# EasyEDA Pro project ProPrj_小车底盘_2026-10-30.epro, schematic Schematic1
Assembly Variant: Basic; Board Name: Board1; Create Date: 2026-10-29; Page Name: P1; Project Name: 小车底盘; Schematic Name: Schematic1; Update Date: 2026-10-29; Company: 嘉立创EDA; Page Size: A4; Version: V1.0
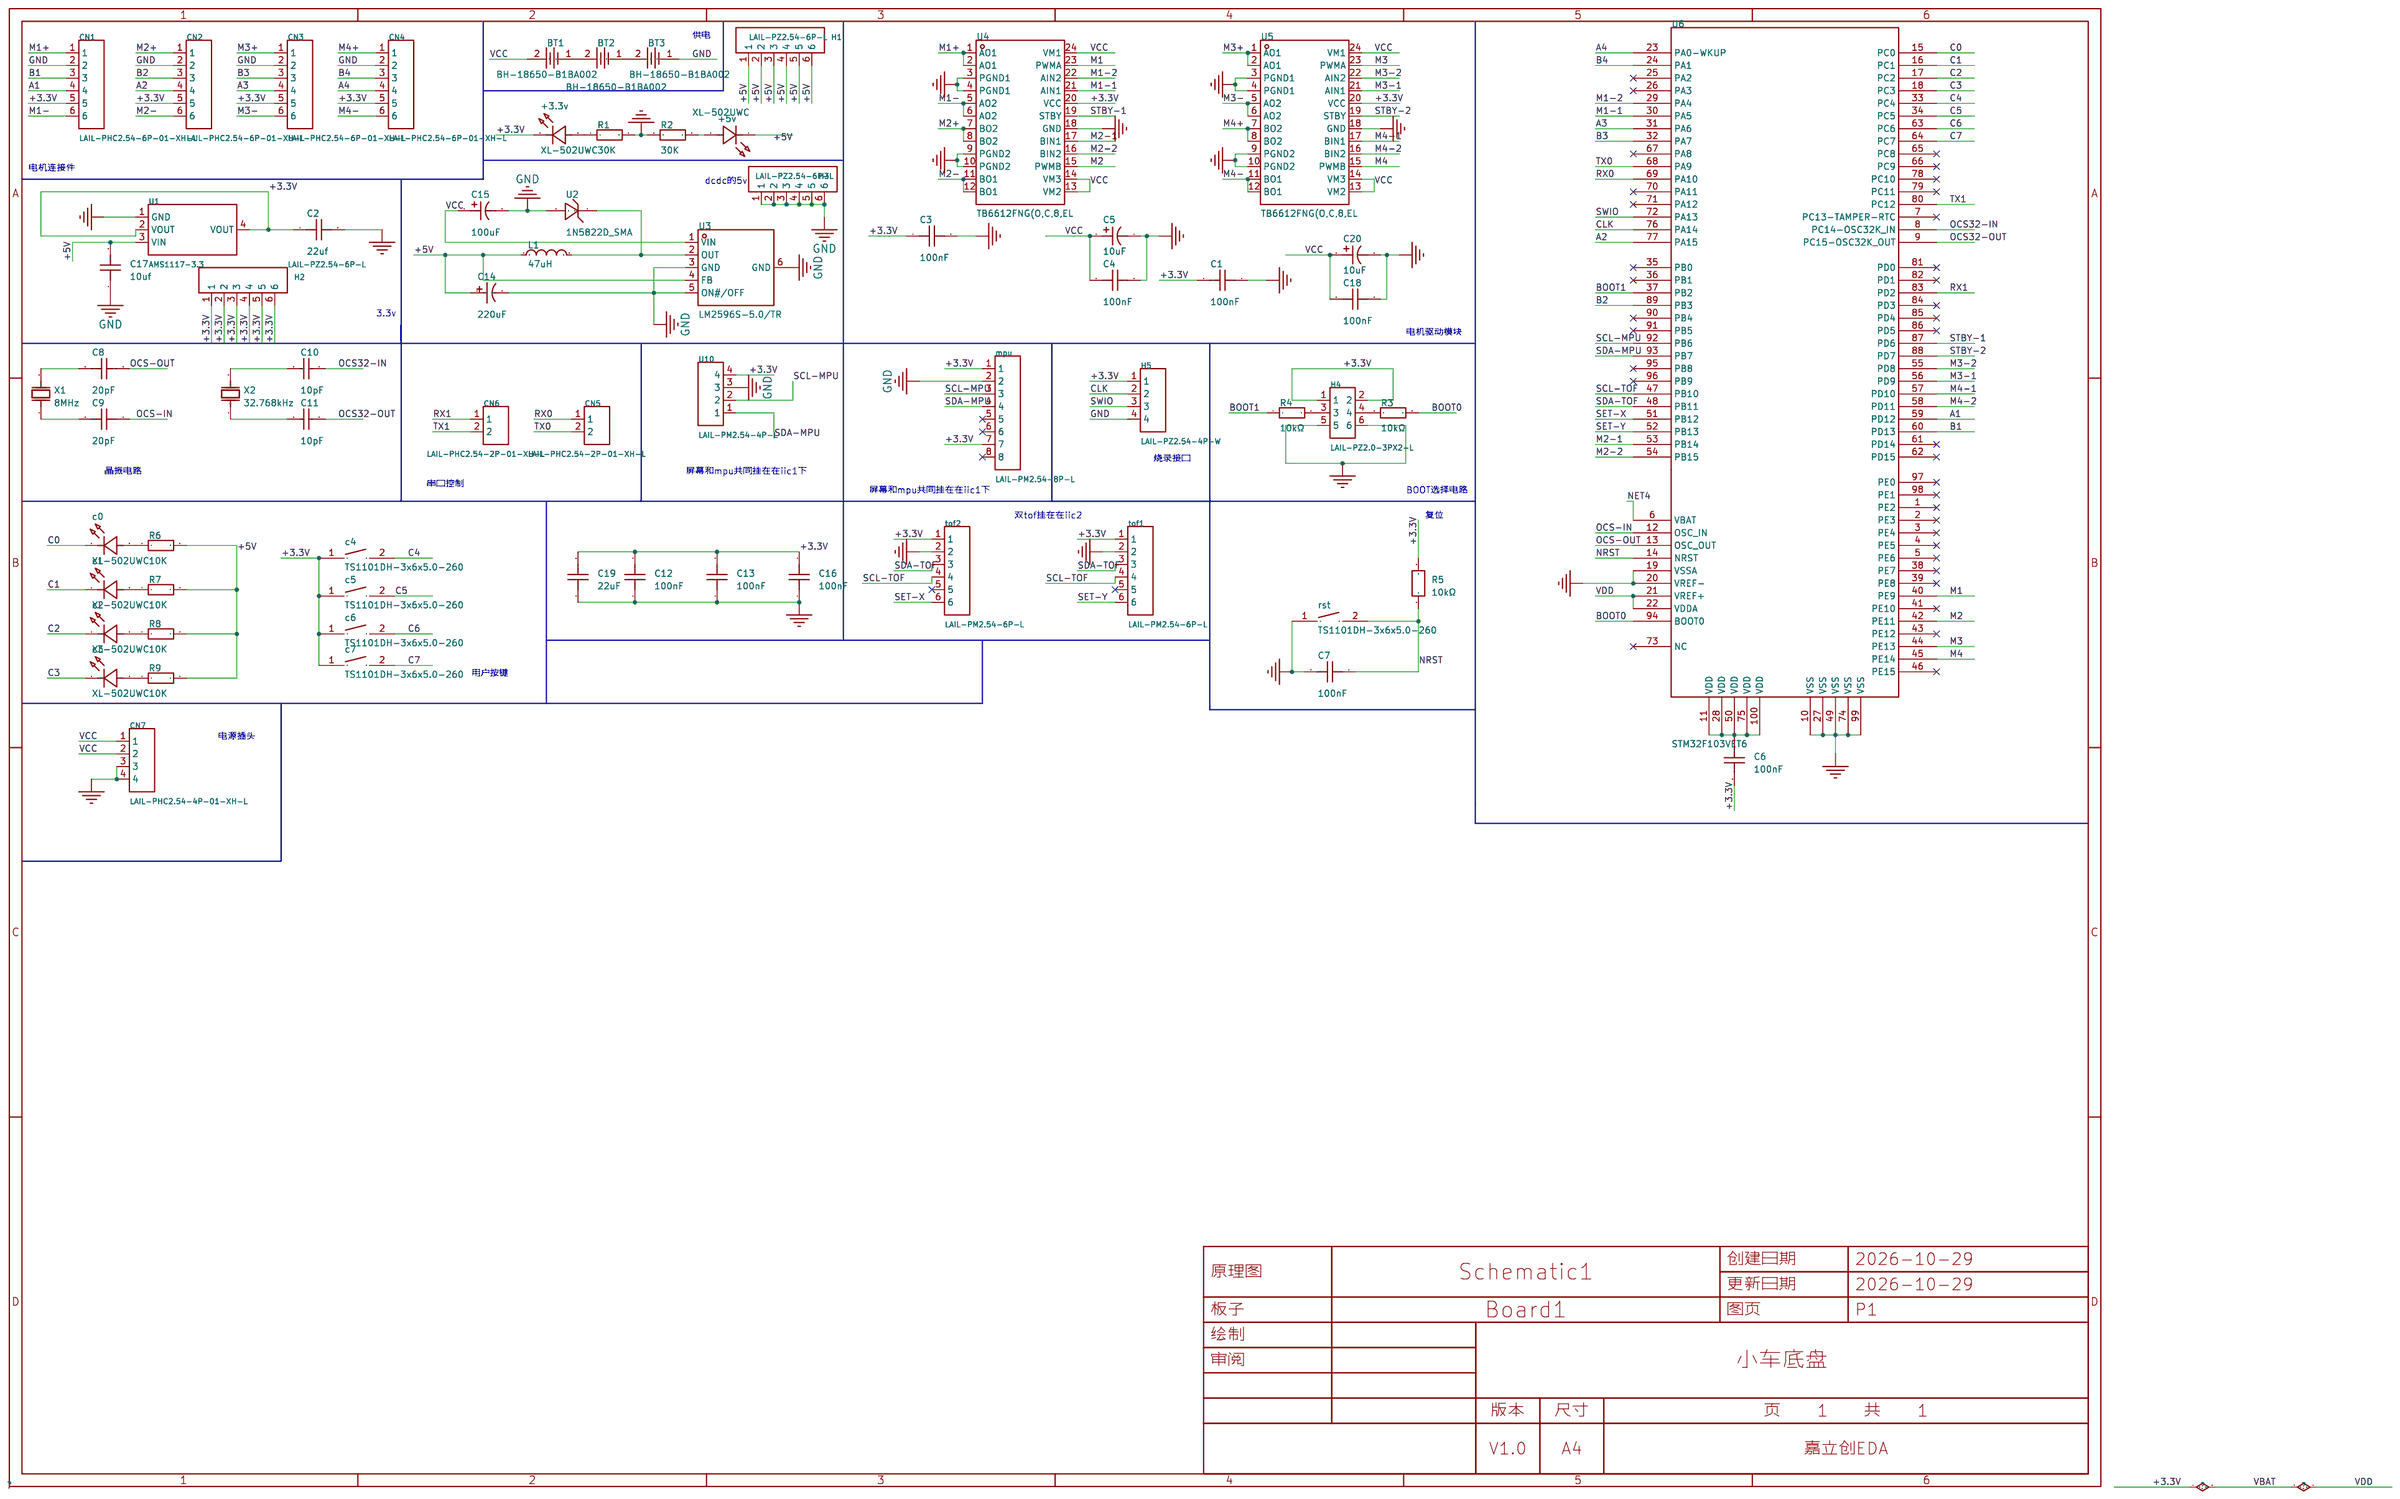
[diagram p0: schematic sheet]

## Parts
+3.3v  XL-502UWC  [LED-TH_BD5.9-P2.54-RD_WHITE]
+5v  XL-502UWC  [LED-TH_BD5.9-P2.54-RD_WHITE]
BT1  BH-18650-B1BA002  [BATTERY-SMD_18650-1S-L77.1-W20.7-1]
BT2  BH-18650-B1BA002  [BATTERY-SMD_18650-1S-L77.1-W20.7-1]
BT3  BH-18650-B1BA002  [BATTERY-SMD_18650-1S-L77.1-W20.7-1]
c0  XL-502UWC  [LED-TH_BD5.9-P2.54-RD_WHITE]
c1  XL-502UWC  [LED-TH_BD5.9-P2.54-RD_WHITE]
C1  100nF  [C0603]
C2  22uf  [C0603]
c2  XL-502UWC  [LED-TH_BD5.9-P2.54-RD_WHITE]
C3  100nF  [C0603]
c3  XL-502UWC  [LED-TH_BD5.9-P2.54-RD_WHITE]
C4  100nF  [C0603]
c4  TS1101DH-3x6x5.0-260  [SW-TH_L6.1-W3.5-P6.60-LS8.0]
C5  10uF  [CAP-SMD_L7.3-W4.3-RD_177EC0013]
c5  TS1101DH-3x6x5.0-260  [SW-TH_L6.1-W3.5-P6.60-LS8.0]
C6  100nF  [C0805]
c6  TS1101DH-3x6x5.0-260  [SW-TH_L6.1-W3.5-P6.60-LS8.0]
C7  100nF  [C0805]
c7  TS1101DH-3x6x5.0-260  [SW-TH_L6.1-W3.5-P6.60-LS8.0]
C8  20pF  [C0805]
C9  20pF  [C0805]
C10  10pF  [C0805]
C11  10pF  [C0805]
C12  100nF  [C0805]
C13  100nF  [C0805]
C14  220uF  [CAP-TH_BD8.0-P3.50-D0.6-FD]
C15  100uF  [CAP-SMD_BD6.3-L6.6-W6.6-RD]
C16  100nF  [C0805]
C17  10uf  [C0603]
C18  100nF  [C0603]
C19  22uF  [C0603]
C20  10uF  [CAP-SMD_L7.3-W4.3-RD_177EC0013]
CN1  LAIL-PHC2.54-6P-01-XH-L  [CONN-TH_AXH-6A-11]
CN2  LAIL-PHC2.54-6P-01-XH-L  [CONN-TH_AXH-6A-11]
CN3  LAIL-PHC2.54-6P-01-XH-L  [CONN-TH_AXH-6A-11]
CN4  LAIL-PHC2.54-6P-01-XH-L  [CONN-TH_AXH-6A-11]
CN5  LAIL-PHC2.54-2P-01-XH-L  [CONN-TH_2P-P2.50_HC-XH-2A-G]
CN6  LAIL-PHC2.54-2P-01-XH-L  [CONN-TH_2P-P2.50_HC-XH-2A-G]
CN7  LAIL-PHC2.54-4P-01-XH-L  [CONN-TH_LAIL-PHC2.54-4P-01-XH-L]
H1  LAIL-PZ2.54-6P-L  [CONN-TH_LAIL-PZ2.54-6P-L]
H2  LAIL-PZ2.54-6P-L  [CONN-TH_LAIL-PZ2.54-6P-L]
H3  LAIL-PZ2.54-6P-L  [CONN-TH_LAIL-PZ2.54-6P-L]
H4  LAIL-PZ2.0-3PX2-L  [CONN-TH_LAIL-PZ2.0-3PX2-L]
H5  LAIL-PZ2.54-4P-W  [HDR-TH_LAIL-PZ2.54-4P-W]
L1  47uH  [IND-SMD_L12.3-W12.3]
mpu  LAIL-PM2.54-8P-L  [HDR-TH_LAIL-PM2.54-8P-L]
R1  30K  [R0603]
R2  30K  [R0603]
R3  10kΩ  [R0805]
R4  10kΩ  [R0805]
R5  10kΩ  [R0603]
R6  10K  [R0603]
R7  10K  [R0603]
R8  10K  [R0603]
R9  10K  [R0603]
rst  TS1101DH-3x6x5.0-260  [SW-TH_L6.1-W3.5-P6.60-LS8.0]
tof1  LAIL-PM2.54-6P-L  [HDR-TH_LAIL-PM2.54-6P-L]
tof2  LAIL-PM2.54-6P-L  [HDR-TH_LAIL-PM2.54-6P-L]
U1  AMS1117-3.3  [SOT-223-3_L6.5-W3.4-P2.30-LS7.0-BR]
U2  1N5822D_SMA  [SMA_L4.3-W2.6-LS5.2-RD]
U3  LM2596S-5.0/TR  [TO-263-5_L10.1-W8.7-P1.70-LS14.4-BR]
U4  TB6612FNG(O,C,8,EL  [SSOP-24_L8.4-W5.8-P0.65-LS7.8-BL]
U5  TB6612FNG(O,C,8,EL  [SSOP-24_L8.4-W5.8-P0.65-LS7.8-BL]
U6  STM32F103VET6  [LQFP-100_L14.0-W14.0-P0.50-LS16.0-BL]
U10  LAIL-PM2.54-4P-L  [HDR-TH_4P-P2.54-V-F]
X1  8MHz  [CRYSTAL-SMD_L5.0-W3.2]
X2  32.768kHz  [CRYSTAL-SMD_L3.2-W1.5-1]

## Library data of the parts
+3.3v +5v c0-c3 = XL-502UWC: 灯头类型:5mm圆形灯头;发光颜色:白色;正向压降(Vf):3.3V;功率:70mW;测试电流:20mA;波长:-;二极管配置:独立二极管;透镜颜色:无色透明透镜;色温:9000K~20000K;发光强度:20cd;发光角度:30°;载带方式:-;工作温度:-25℃~+85℃;; LCSC Part Name: F5白发白短脚; Supplier Part: C2895480; Manufacturer: XINGLIGHT(成兴光); Supplier Footprint: 插件,D=5mm; JLCPCB Part Class: Extended Part; Datasheet: https://item.szlcsc.com/datasheet/XL-502UWC/3136195.html; Supplier: LCSC; Lamp Holder Type: 5mm圆形灯头; Illumination Color: 白色; Voltage - Forward(Vf): 3.3V; Power(Watts): 70mW; Test Current: 20mA; Diode Configuration: 独立二极管; Lens Color: 无色透明透镜; Color Temperature: 9000K~20000K; Luminous Intensity: 20cd; Viewing Angle: 30°; Operating Temperature: -25℃~+85℃
BT1-BT3 = BH-18650-B1BA002: BHAu SMT/适用电池18650平头电芯//电池底座/ 卧式自动化生产贴片电池盒/符合耐高温SMT回流焊工艺/材质：PA46/SUS304 T=0.35mm/镀金/; LCSC Part Name: MYOUNG(美阳)电池盒 BHAu 适用电池18650平头电芯、电池底座、卧式自动化生产贴片电池盒、SMT 180° TYPE; Supplier Part: C2988620; Manufacturer: MYOUNG(美阳); JLCPCB Part Class: Extended Part; Datasheet: https://item.szlcsc.com/datasheet/BH-18650-B1BA002/3446919.html; Supplier: LCSC; Type: 电池盒; Operating Temperature: -25~85℃; Contact material: 磷青铜; Contact coating: 镀金; Applicable battery specifications: 18650
C1-C4 C17 C18 = CAP_0603: Supplier Footprint: 0603
c4-c7 rst = TS1101DH-3x6x5.0-260: 轻触开关3.5x6x5.0立式插件，260GF，2.6N，黑色基座; Supplier Part: C54123271; Manufacturer: CAX(创都); Supplier Footprint: 插件,6.1x3.5mm; JLCPCB Part Class: Extended Part; Datasheet: https://item.szlcsc.com/datasheet/TS1101DH-3x6x5.0-260/57348502.html; Supplier: LCSC
C5 C20 = TA16R0M100AR40: 容值:100uF;精度:±20%;额定电压:16V;等效串联电阻(ESR):40mΩ@100kHz;; LCSC Part Name: 100uF ±20% 16V; Supplier Part: C49332981; Manufacturer: JIERR(捷而瑞); Supplier Footprint: CASE-A-7343-19(mm); JLCPCB Part Class: Extended Part; Datasheet: https://item.szlcsc.com/datasheet/TA16R0M100AR40/51817335.html; Supplier: LCSC; Tolerance: ±20%; Voltage Rating: 16V; Current - Leakage: 160uA@20℃,2min; Ripple Current: 2.2A@100kHz; Equivalent Series Resistance(ESR): 40mΩ@100kHz; Operating Temperature: -55℃~+105℃
C6 C7 C12 C13 C16 = FCC0805B104K500DT: 容值:100nF;精度:±10%;额定电压:50V;温度系数:X7R;; LCSC Part Name: 100nF ±10% 50V; Supplier Part: C5137467; Manufacturer: FOJAN(富捷); Supplier Footprint: 0805; JLCPCB Part Class: Extended Part; Datasheet: https://item.szlcsc.com/datasheet/FCC0805B104K500DT/5746969.html; Supplier: LCSC; Tolerance: ±10%; Voltage Rating: 50V; Temperature Coefficient: X7R; Operating Temperature: -55℃~+125℃
C8 C9 = 0805CG200J500NT: 容值:20pF;精度:±5%;额定电压:50V;温度系数:C0G;; LCSC Part Name: 20pF ±5% 50V; Supplier Part: C94472; Manufacturer: FH(风华); Supplier Footprint: 0805; JLCPCB Part Class: Extended Part; Datasheet: https://item.szlcsc.com/datasheet/0805CG200J500NT/95670.html; Supplier: LCSC; Tolerance: ±5%; Voltage Rating: 50V; Temperature Coefficient: C0G
C10 C11 = CC0805JRNPO9BN100: 容值:10pF;精度:±5%;额定电压:50V;材质(温度系数):NP0;; LCSC Part Name: 10pF ±5% 50V; Supplier Part: C107107; Manufacturer: YAGEO(国巨); Supplier Footprint: 0805; JLCPCB Part Class: Extended Part; Datasheet: https://atta.szlcsc.com/upload/public/pdf/source/20231121/E6B7358C10879AC104478A67BFFD3D0E.pdf; Supplier: LCSC; Tolerance: ±5%; Voltage Rated: 50V; Temperature Coefficient: NP0
C14 = ERS1VM221F12OT: 容值:220uF;精度:±20%;额定电压:35V;; LCSC Part Name: 220uF ±20% 35V; Supplier Part: C106697; Manufacturer: AISHI(艾华集团); Supplier Footprint: 插件,D8xL12mm; Datasheet: https://atta.szlcsc.com/upload/public/pdf/source/20191015/C438940_4B8E60A742BB0AE40DDEF87A5C89089D.pdf; Supplier: LCSC; Tolerance: ±20%; Rated Voltage: 35V; Lead Spacing: 3.5mm; φD: 8mm; L: 12mm; Lifetime @ Temp: 7000hrs@105℃
C15 = MA35V100M6X8: 容值:100uF;精度:±20%;额定电压:35V;纹波电流:2.9A@100kHz;等效串联电阻(ESR):30mΩ@100kHz;类型:聚合物;; LCSC Part Name: 100uF ±20% 35V; Supplier Part: C46550467; Manufacturer: JIERR(捷而瑞); Supplier Footprint: SMD,D6.3xL7.7mm; JLCPCB Part Class: Extended Part; Datasheet: https://item.szlcsc.com/datasheet/MA35V100M6X8/48680161.html; Supplier: LCSC; Tolerance: ±20%; Voltage Rating: 35V; Ripple Current: 2.9A@100kHz; Equivalent Series Resistance(ESR): 30mΩ@100kHz; Type: 聚合物; Diameter: 6.3mm; Height - Seated (Max): 7mm; Lifetime: 2000hrs@105℃; Operating Temperature: -55℃~+105℃; Polarity type: 有极性
C19 = HGC0603R5226M160NTHJ: 容值:22uF;精度:±20%;额定电压:16V;温度系数:X5R;; LCSC Part Name: 22uF ±20% 16V; Supplier Part: C22367828; Manufacturer: Chinocera(华瓷); Supplier Footprint: 0603; JLCPCB Part Class: Extended Part; Datasheet: https://item.szlcsc.com/datasheet/HGC0603R5226M160NTHJ/23841133.html; Supplier: LCSC; Tolerance: ±20%; Voltage Rating: 16V; Temperature Coefficient: X5R
CN1-CN4 = LAIL-PHC2.54-6P-01-XH-L: 插针结构:1x6P;间距:2.54mm;安装方式:直插;参考系列:XH;总PIN数:6P;排数:1;每排PIN数:6;额定电流:3A;触头材质:黄铜;触头镀层:锡;工作温度:-25℃~+85℃;; LCSC Part Name: 1x6P 间距:2.54mm 直插 系列:XH; Supplier Part: C54905977; Manufacturer: LAILAN(莱联); Supplier Footprint: 插件,P=2.5mm; JLCPCB Part Class: Extended Part; Datasheet: https://item.szlcsc.com/datasheet/LAIL-PHC2.54-6P-01-XH-L/58431104.html; Supplier: LCSC; Pins Structure: 1x6P; Pitch: 2.54mm; Mounting Type: 直插; Reference Series: XH; Number of Pins: 6P; Number of Rows: 1; Number of PINs Per Row: 6; Current Rating: 3A; Contact Material: 黄铜; Contact Plating: 锡; Operating Temperature: -25℃~+85℃; Voltage Rating: 250V; Plastic Material: PA66; Flame Retardant Rating: UL94V-0; Color: 白色; Z-Height of the Board: 7.1mm; X-Length of Bottom Edge on Board (Spacing Line): 17.5mm; Y-Width of Bottom Edge on Board: 5.8mm
CN5 CN6 = LAIL-PHC2.54-2P-01-XH-L: 插针结构:1x2P;间距:2.5mm;安装方式:直插;参考系列:XH;总PIN数:2P;排数:1;每排PIN数:2;行距:-;额定电流:3A;触头材质:黄铜;触头镀层:锡;工作温度:-25℃~+85℃;; LCSC Part Name: 1x2P 间距:2.5mm 直插 系列:XH; Supplier Part: C54905973; Manufacturer: LAILAN(莱联); Supplier Footprint: 插件,P=2.5mm; JLCPCB Part Class: Extended Part; Datasheet: https://item.szlcsc.com/datasheet/LAIL-PHC2.54-2P-01-XH-L/58431100.html; Supplier: LCSC; Pins Structure: 1x2P; Pitch: 2.5mm; Mounting Type: 直插; Reference Series: XH; Number of Pins: 2P; Number of Rows: 1; Number of PINs Per Row: 2; Current Rating: 3A; Contact Material: 黄铜; Contact Plating: 锡; Operating Temperature: -25℃~+85℃; Voltage Rating: 250V; Plastic Material: PA66; Flame Retardant Rating: UL94V-0; Color: 白色; Z-Height of the Board: 7.1mm; X-Length of Bottom Edge on Board (Spacing Line): 7.5mm; Y-Width of Bottom Edge on Board: 5.8mm
CN7 = LAIL-PHC2.54-4P-01-XH-L: 插针结构:1x4P;间距:2.54mm;安装方式:直插;参考系列:XH;总PIN数:4P;排数:1;每排PIN数:4;额定电流:3A;触头材质:黄铜;触头镀层:锡;工作温度:-25℃~+85℃;; LCSC Part Name: 1x4P 间距:2.54mm 直插 系列:XH; Supplier Part: C54905972; Manufacturer: LAILAN(莱联); Supplier Footprint: 插件,P=2.5mm; JLCPCB Part Class: Extended Part; Datasheet: https://item.szlcsc.com/datasheet/LAIL-PHC2.54-4P-01-XH-L/58431099.html; Supplier: LCSC; Pins Structure: 1x4P; Pitch: 2.54mm; Mounting Type: 直插; Reference Series: XH; Number of Pins: 4P; Number of Rows: 1; Number of PINs Per Row: 4; Current Rating: 3A; Contact Material: 黄铜; Contact Plating: 锡; Operating Temperature: -25℃~+85℃; Voltage Rating: 250V; Plastic Material: PA66; Flame Retardant Rating: UL94V-0; Color: 白色; Z-Height of the Board: 7.1mm; X-Length of Bottom Edge on Board (Spacing Line): 11mm; Y-Width of Bottom Edge on Board: 5.8mm
H1-H3 = LAIL-PZ2.54-6P-L: 插针结构:1x6P;间距:2.54mm;圆针/方针:方针;安装方式:直插;排数:单排;总PIN位数:6P;额定电流:3A;额定电压:250V;配合针长度:6mm;塑高:2.5mm;端接针长度:3mm;触头材质:黄铜;触头镀层:金;工作温度:-25℃~+80℃;颜色:黑色;; LCSC Part Name: 1x6P 间距:2.54mm 方针 直插; Supplier Part: C54950607; Manufacturer: LAILAN(莱联); Supplier Footprint: 插件,P=2.54mm; JLCPCB Part Class: Extended Part; Datasheet: https://item.szlcsc.com/datasheet/LAIL-PZ2.54-6P-L/58519960.html; Supplier: LCSC; Pin Structure: 1x6P; Pitch: 2.54mm; Circluar Pins/Square Pins: 方针; Mounting Type: 直插; Number of Rows: 单排; Number of Pins: 6P; Current Rating: 3A; Voltage Rating (Max): 250V; Length of Mating Pin: 6mm; Insulation Height: 2.5mm; Length of End Connection Pin: 3mm; Contact Material: 黄铜; Contact Plating: 金; Operating Temperature: -25℃~+80℃; Color: 黑色
H4 = LAIL-PZ2.0-3PX2-L: 插针结构:2x3P;间距:2mm;行距:2mm;圆针/方针:方针;安装方式:直插;排数:双排;总PIN位数:6P;额定电流:2A;额定电压:250V;配合针长度:4mm;塑高:2mm;端接针长度:2.8mm;触头材质:黄铜;触头镀层:金;工作温度:-25℃~+80℃;颜色:黑色;; LCSC Part Name: 2x3P 间距:2mm 方针 直插; Supplier Part: C54950580; Manufacturer: LAILAN(莱联); Supplier Footprint: 插件,P=2mm; JLCPCB Part Class: Extended Part; Datasheet: https://item.szlcsc.com/datasheet/LAIL-PZ2.0-3PX2-L/58519933.html; Supplier: LCSC; Pin Structure: 2x3P; Pitch: 2mm; Row Spacing: 2mm; Circluar Pins/Square Pins: 方针; Mounting Type: 直插; Number of Rows: 双排; Number of Pins: 6P; Current Rating: 2A; Voltage Rating (Max): 250V; Length of Mating Pin: 4mm; Insulation Height: 2mm; Length of End Connection Pin: 2.8mm; Contact Material: 黄铜; Contact Plating: 金; Operating Temperature: -25℃~+80℃; Color: 黑色
H5 = LAIL-PZ2.54-4P-W: 插针结构:1x4P;间距:2.54mm;圆针/方针:方针;安装方式:弯插;排数:单排;总PIN位数:4P;额定电流:3A;额定电压:250V;配合针长度:6mm;塑高:2.5mm;触头材质:黄铜;触头镀层:金;工作温度:-25℃~+80℃;颜色:黑色;; LCSC Part Name: 1x4P 间距:2.54mm 方针 弯插; Supplier Part: C54950589; Manufacturer: LAILAN(莱联); Supplier Footprint: 弯插,P=2.54mm; JLCPCB Part Class: Extended Part; Datasheet: https://item.szlcsc.com/datasheet/LAIL-PZ2.54-4P-W/58519942.html; Supplier: LCSC; Pin Structure: 1x4P; Pitch: 2.54mm; Circluar Pins/Square Pins: 方针; Mounting Type: 弯插; Number of Rows: 单排; Number of Pins: 4P; Current Rating: 3A; Voltage Rating (Max): 250V; Length of Mating Pin: 6mm; Insulation Height: 2.5mm; Contact Material: 黄铜; Contact Plating: 金; Operating Temperature: -25℃~+80℃; Color: 黑色
L1 = CDRH127N-470M: 电感值:47uH;精度:±20%;额定电流:-;饱和电流(Isat):-;; LCSC Part Name: 47uH ±20%; Supplier Part: C962356; Manufacturer: MINGSTAR(登壹); Supplier Footprint: SMD,12.3x12.3mm; JLCPCB Part Class: 扩展库; Datasheet: https://atta.szlcsc.com/upload/public/pdf/source/20201218/C962356_DBB80431F2386180CBD0A67FB703DD56.pdf; Supplier: LCSC; Tolerance: ±20%
mpu = LAIL-PM2.54-8P-L: 插孔结构:1x8P;间距:2.54mm;圆孔/方孔:方孔;安装方式:直插;排数:单排;总孔位数:8P;额定电流:3A;额定电压:250V;插孔方向:顶部;塑高:8.5mm;触头材质:黄铜;触头镀层:金;工作温度:-25℃~+80℃;; LCSC Part Name: 1x8P 间距:2.54mm 直插; Supplier Part: C54973824; Manufacturer: LAILAN(莱联); Supplier Footprint: 插件,P=2.54mm; JLCPCB Part Class: Extended Part; Datasheet: https://item.szlcsc.com/datasheet/LAIL-PM2.54-8P-L/58554902.html; Supplier: LCSC; Holes Structure: 1x8P; Pitch: 2.54mm; Circular Hole / Square Hole: 方孔; Mounting Type: 直插; Number of Rows: 单排; Number of Positions: 8P; Current Rating: 3A; Voltage Rating (Max): 250V; Holes Direction: 顶部; Insulation Height: 8.5mm; Contact Material: 黄铜; Contact Plating: 金; Operating Temperature: -25℃~+80℃; PIN Length: 3mm
R1 R2 R6-R9 = Res_0603: Supplier Footprint: 0603
R3 R4 = RT0805BRD0710KL: 电阻类型:薄膜电阻;阻值:10kΩ;精度:±0.1%;功率:125mW;工作电压:150V;温度系数:±25ppm/℃;; LCSC Part Name: 薄膜电阻 10kΩ ±0.1% 125mW; Supplier Part: C110775; Manufacturer: YAGEO(国巨); Supplier Footprint: 0805; JLCPCB Part Class: Extended Part; Datasheet: https://item.szlcsc.com/datasheet/RT0805BRD0710KL/112000.html; Supplier: LCSC; Type: 薄膜电阻; Tolerance: ±0.1%; Power(Watts): 125mW; Voltage-Supply(Max): 150V; Temperature Coefficient: ±25ppm/℃; Operating Temperature: -55℃~+155℃
R5 = FRC0603J103 TS: 电阻类型:厚膜电阻;阻值:10kΩ;精度:±5%;功率:100mW;工作电压:75V;温度系数:±100ppm/℃;; LCSC Part Name: 10kΩ ±5% 100mW 厚膜电阻; Supplier Part: C2930027; Manufacturer: FOJAN(富捷); Supplier Footprint: 0603; JLCPCB Part Class: Extended Part; Datasheet: https://item.szlcsc.com/datasheet/FRC0603J103%2520TS/3266960.html; Supplier: LCSC; Type: 厚膜电阻; Tolerance: ±5%; Power(Watts): 100mW; Voltage-Supply(Max): 75V; Temperature Coefficient: ±100ppm/℃; Operating Temperature: -55℃~+155℃
tof1 tof2 = LAIL-PM2.54-6P-L: 插孔结构:1x6P;间距:2.54mm;圆孔/方孔:方孔;安装方式:直插;排数:单排;总孔位数:6P;额定电流:3A;额定电压:250V;插孔方向:顶部;塑高:8.5mm;触头材质:黄铜;触头镀层:金;工作温度:-25℃~+80℃;; LCSC Part Name: 1x6P 间距:2.54mm 直插; Supplier Part: C54973826; Manufacturer: LAILAN(莱联); Supplier Footprint: 插件,P=2.54mm; JLCPCB Part Class: Extended Part; Datasheet: https://item.szlcsc.com/datasheet/LAIL-PM2.54-6P-L/58554904.html; Supplier: LCSC; Holes Structure: 1x6P; Pitch: 2.54mm; Circular Hole / Square Hole: 方孔; Mounting Type: 直插; Number of Rows: 单排; Number of Positions: 6P; Current Rating: 3A; Voltage Rating (Max): 250V; Holes Direction: 顶部; Insulation Height: 8.5mm; Contact Material: 黄铜; Contact Plating: 金; Operating Temperature: -25℃~+80℃; PIN Length: 3mm
U1 = AMS1117-3.3_C6186: 输出极性:正极;工作电压:15V;输出电压:3.3V;输出电流:1A;电源纹波抑制比(PSRR):72dB@(120Hz);输出类型:固定;; LCSC Part Name: 3.3V 1A 15V; Supplier Part: C6186; Manufacturer: Advanced Monolithic Systems; Supplier Footprint: SOT-223; JLCPCB Part Class: Basic Part; Datasheet: https://item.szlcsc.com/datasheet/AMS1117-3.3/6652.html; Supplier: LCSC; Output Configuration: 正极; Voltage - Supply: 15V; Output Voltage: 3.3V; Output Current: 1A; Power Supply Rejection Ratio (PSRR): 72dB@(120Hz); Voltage Dropout: 1.1V@(800mA); standby current: 5mA; Noise: 0.003%Vout; Features: 短路保护；热关断；过流保护; Operating Temperature: -40℃~+125℃; Output Type: 固定; Number of Outputs: 1
U2 = 1N5822D_SMA: Supplier Part: C9900001949; Supplier Footprint: SMA_L4.3-W2.6-LS5.2; JLCPCB Part Class: 扩展库; Supplier: LCSC
U3 = LM2596S-5.0/TR_C459077: Supplier Part: C459077; Supplier Footprint: TO-263-5; JLCPCB Part Class: 扩展库; Supplier: LCSC
U4 U5 = TB6612FNG(O,C,8,EL: 双直流电机驱动器集成电路; LCSC Part Name: 双直流电机驱动IC; Supplier Part: C88224; Manufacturer: TOSHIBA(东芝); Supplier Footprint: SSOP-24-208mil; JLCPCB Part Class: Extended Part; Datasheet: https://item.szlcsc.com/datasheet/TB6612FNG(O%252CC%252C8%252CEL/89402.html; Supplier: LCSC; Technology: 是; Number of H-bridges: 2; Output Current: 1A; Peak Current: 3.2A; Voltage - Supply: 2.7V~5.5V; RDS(on): 500mΩ; Quiescent Current(Iq): 1uA; Operating Temperature: -20℃~+85℃; Features: 主动制动功能；交错导通保护
U6 = STM32F103VET6: CPU内核:ARM Cortex-M3;CPU最大主频:72MHz;CPU位数:32 Bit;; LCSC Part Name: 主流增强型ARM Cortex-M3 MCU，具有512 KB Flash、72 MHz CPU、电机控制、USB和CAN; Supplier Part: C8308; Manufacturer: ST(意法半导体); Supplier Footprint: LQFP-100(14x14); JLCPCB Part Class: Extended Part; Datasheet: https://item.szlcsc.com/datasheet/STM32F103VET6/8800.html; Supplier: LCSC; CPU Core: ARM Cortex-M3; CPU Maximum Speed: 72MHz; Core Size: 32 Bit; Program Storage Size: 512KB; Program Memory Type: FLASH; RAM Size: 64KB; Number of I/O: 80; ADC (Bit): 12bit; DAC (Bit): 12bit; Oscillator Type: 内置; Voltage - Supply: 2V~3.6V; Operating Temperature: -40℃~+85℃
U10 = LAIL-PM2.54-4P-L: 插孔结构:1x4P;间距:2.54mm;圆孔/方孔:方孔;安装方式:直插;排数:单排;总孔位数:4P;额定电流:3A;额定电压:250V;插孔方向:顶部;塑高:8.5mm;触头材质:黄铜;触头镀层:金;工作温度:-25℃~+80℃;; LCSC Part Name: 1x4P 间距:2.54mm 直插; Supplier Part: C54973823; Manufacturer: LAILAN(莱联); Supplier Footprint: 插件,P=2.54mm; JLCPCB Part Class: Extended Part; Datasheet: https://item.szlcsc.com/datasheet/LAIL-PM2.54-4P-L/58554901.html; Supplier: LCSC; Holes Structure: 1x4P; Pitch: 2.54mm; Circular Hole / Square Hole: 方孔; Mounting Type: 直插; Number of Rows: 单排; Number of Positions: 4P; Current Rating: 3A; Voltage Rating (Max): 250V; Holes Direction: 顶部; Insulation Height: 8.5mm; Contact Material: 黄铜; Contact Plating: 金; Operating Temperature: -25℃~+80℃; PIN Length: 3mm
X1 = XG1EL89CSI-111YLC-8M: 晶振类型:贴片晶振;频率:8MHz;常温频差:±10ppm;负载电容:20pF;频率稳定度:±20ppm;; LCSC Part Name: YSX530GA 8MHZ 2P 5032 20PF ±10PPM -40~85℃ (±30PPM); Supplier Part: C5280575; Manufacturer: YXC(扬兴晶振); Supplier Footprint: SMD5032-2P; JLCPCB Part Class: Extended Part; Datasheet: https://item.szlcsc.com/datasheet/XG1EL89CSI-111YLC-8M/6016757.html; Supplier: LCSC; Type: 贴片晶振; Normal temperature Frequency Tolerance: ±10ppm; Load Capacitance: 20pF; Frequency Stability: ±20ppm; Equivalent Series Resistance(ESR): 80Ω; Operating Temperature: -40℃~+85℃
X2 = XKXGI-SUA-32.768K: 晶振类型:贴片晶振;频率:32.768kHz;常温频差:±20ppm;负载电容:12.5pF;频率稳定度:±30ppm;; LCSC Part Name: YST310S 32.768KHZ 2P 3215 12.5PF ±20PPM -40~85℃; Supplier Part: C5213671; Manufacturer: YXC(扬兴晶振); Supplier Footprint: SMD3215-2P; JLCPCB Part Class: Extended Part; Datasheet: https://item.szlcsc.com/datasheet/XKXGI-SUA-32.768K/5908943.html; Supplier: LCSC; Type: 贴片晶振; Normal temperature Frequency Tolerance: ±20ppm; Load Capacitance: 12.5pF; Frequency Stability: ±30ppm; Equivalent Series Resistance(ESR): 70kΩ; Operating Temperature: -40℃~+85℃

## Nets
+3.3V: +3.3v.1(K) C1.1 C2.1 C3.1 c4.1 c5.1 C6.1 c6.1 c7.1 C12.2 C13.2 C16.2 C19.2 CN1.5 CN2.5 CN3.5 CN4.5 H2.1 H2.2 H2.3 H2.4 H2.5 H2.6 H4.1 H4.2 H5.1 mpu.1 mpu.7 R5.2 tof1.1 tof2.1 U1.2(VOUT) U1.4(VOUT) U4.20(VCC) U5.20(VCC) U6.21(VREF+) U6.22(VDDA) U10.4
+5V: +5v.1(K) C14.1 C17.2 H1.1 H1.2 H1.3 H1.4 H1.5 H1.6 L1.1 R6.2 R7.2 R8.2 R9.2 U1.3(VIN) U3.4(FB)
GND: BT3.1 C1.2 C2.2 C3.2 C4.2 C5.1 C7.2 C12.1 C13.1 C14.2 C16.1 C17.1 C18.2 C19.1 C20.1 CN1.2 CN2.2 CN3.2 CN4.2 CN7.3 CN7.4 H3.1 H3.2 H3.3 H3.4 H3.5 H3.6 H4.5 H4.6 H5.4 mpu.2 R1.2 R2.2 rst.1 tof1.2 tof2.2 U1.1(GND) U2.2(A) U3.3(GND) U3.5(ON#/OFF) U3.6(GND) U4.3(PGND1) U4.4(PGND1) U4.9(PGND2) U4.10(PGND2) U4.18(GND) U5.3(PGND1) U5.4(PGND1) U5.9(PGND2) U5.10(PGND2) U5.18(GND) U6.10(VSS) U6.19(VSSA) U6.20(VREF-) U6.27(VSS) U6.49(VSS) U6.74(VSS) U6.99(VSS) U10.3
VCC: BT1.2 C4.1 C5.2 C18.1 C20.2 CN7.1 CN7.2 U3.1(VIN) U4.13(VM2) U4.14(VM3) U4.24(VM1) U5.13(VM2) U5.14(VM3) U5.24(VM1)
A1: CN1.4 U6.59(PD12)
A2: CN2.4 U6.77(PA15)
A3: CN3.4 U6.31(PA6)
A4: CN4.4 U6.23(PA0-WKUP)
B1: CN1.3 U6.60(PD13)
B2: CN2.3 U6.89(PB3)
B3: CN3.3 U6.32(PA7)
B4: CN4.3 U6.24(PA1)
BOOT0: R3.2 U6.94(BOOT0)
BOOT1: R4.1 U6.37(PB2)
C0: c0.1(K) U6.15(PC0)
C1: c1.1(K) U6.16(PC1)
C2: c2.1(K) U6.17(PC2)
C3: c3.1(K) U6.18(PC3)
C4: c4.2 U6.33(PC4)
C5: c5.2 U6.34(PC5)
C6: c6.2 U6.63(PC6)
C7: c7.2 U6.64(PC7)
CLK: H5.2 U6.76(PA14)
M1: U4.23(PWMA) U6.40(PE9)
M1+: CN1.1 U4.1(AO1) U4.2(AO1)
M1-: CN1.6 U4.5(AO2) U4.6(AO2)
M1-1: U4.21(AIN1) U6.30(PA5)
M1-2: U4.22(AIN2) U6.29(PA4)
M2: U4.15(PWMB) U6.42(PE11)
M2+: CN2.1 U4.7(BO2) U4.8(BO2)
M2-: CN2.6 U4.11(BO1) U4.12(BO1)
M2-1: U4.17(BIN1) U6.53(PB14)
M2-2: U4.16(BIN2) U6.54(PB15)
M3: U5.23(PWMA) U6.44(PE13)
M3+: CN3.1 U5.1(AO1) U5.2(AO1)
M3-: CN3.6 U5.5(AO2) U5.6(AO2)
M3-1: U5.21(AIN1) U6.56(PD9)
M3-2: U5.22(AIN2) U6.55(PD8)
M4: U5.15(PWMB) U6.45(PE14)
M4+: CN4.1 U5.7(BO2) U5.8(BO2)
M4-: CN4.6 U5.11(BO1) U5.12(BO1)
M4-1: U5.17(BIN1) U6.57(PD10)
M4-2: U5.16(BIN2) U6.58(PD11)
NET4: U6.6(VBAT)
NRST: C7.1 R5.1 rst.2 U6.14(NRST)
OCS32-IN: C10.2 U6.8(PC14-OSC32K_IN)
OCS32-OUT: C11.2 U6.9(PC15-OSC32K_OUT)
OCS-IN: C9.1 U6.12(OSC_IN)
OCS-OUT: C8.2 U6.13(OSC_OUT)
RX0: CN5.1 U6.69(PA10)
RX1: CN6.1 U6.83(PD2)
SCL-MPU: mpu.3 U6.92(PB6) U10.2
SCL-TOF: tof1.4 tof2.4 U6.47(PB10)
SDA-MPU: mpu.4 U6.93(PB7) U10.1
SDA-TOF: tof1.3 tof2.3 U6.48(PB11)
SET-X: tof2.6 U6.51(PB12)
SET-Y: tof1.6 U6.52(PB13)
STBY-1: U4.19(STBY) U6.87(PD6)
STBY-2: U5.19(STBY) U6.88(PD7)
SWIO: H5.3 U6.72(PA13)
TX0: CN5.2 U6.68(PA9)
TX1: CN6.2 U6.80(PC12)
$1N25: BT1.1 BT2.2
$1N26: BT2.1 BT3.2
$1N41: L1.2 U2.1(C) U3.2(OUT)
$1N46: +3.3v.2(A) R1.1
$1N47: +5v.2(A) R2.1
$1N102: C6.2 U6.11(VDD) U6.28(VDD) U6.50(VDD) U6.75(VDD) U6.100(VDD)
$1N107: H4.3 R4.2
$1N108: H4.4 R3.1
$1N153: C8.1 X1.2(OSC2)
$1N154: C9.2 X1.1(OSC1)
$1N159: C10.1 X2.2(OSC2)
$1N160: C11.1 X2.1(OSC1)
$1N223: c0.2(A) R6.1
$1N224: c1.2(A) R7.1
$1N225: c2.2(A) R8.1
$1N226: c3.2(A) R9.1

Not connected (* = marked no-connect by the designer): C15 1 2; mpu 5* 6* 8*; tof1 5*; tof2 5*; U6 1(PE2)* 2(PE3)* 3(PE4)* 4(PE5)* 5(PE6)* 7(PC13-TAMPER-RTC)* 25(PA2)* 26(PA3)* 35(PB0)* 36(PB1)* 38(PE7)* 39(PE8)* 41(PE10)* 43(PE12)* 46(PE15)* 61(PD14)* 62(PD15)* 65(PC8)* 66(PC9)* 67(PA8)* 70(PA11)* 71(PA12)* 73(NC)* 78(PC10)* 79(PC11)* 81(PD0)* 82(PD1)* 84(PD3)* 85(PD4)* 86(PD5)* 90(PB4)* 91(PB5)* 95(PB8)* 96(PB9)* 97(PE0)* 98(PE1)*

## Notes on the sheet
- 供电
- 电机连接件
- dcdc的5v
- 3.3v
- 电机驱动模块
- 烧录接口
- 晶振电路
- 屏幕和mpu共同挂在在iic1下
- 串口控制
- 屏幕和mpu共同挂在在iic1下
- BOOT选择电路
- 双tof挂在在iic2
- 复位
- 用户按键
- 电源插头
